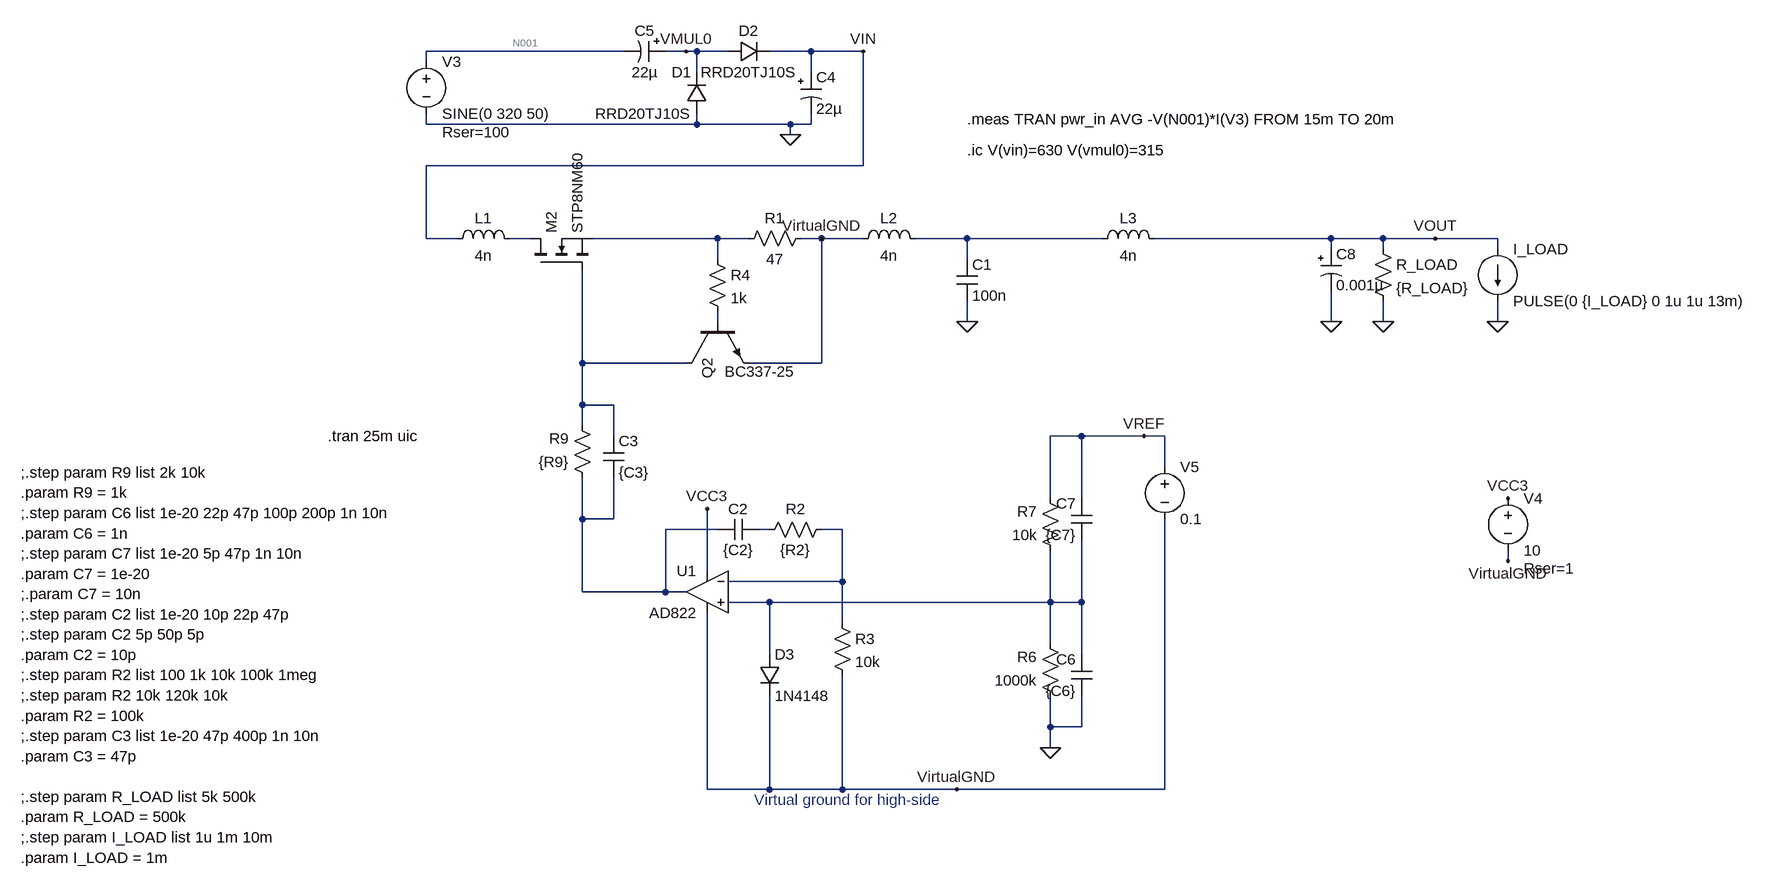
[diagram p0: schematic high_voltage_power_supply_Tim1.asc]
high_voltage_power_supply_Tim1.asc, the LTspice schematic file:
Version 4
SHEET 1 2484 1152
WIRE 464 -288 160 -288
WIRE 560 -288 528 -288
WIRE 576 -288 560 -288
WIRE 624 -288 576 -288
WIRE 752 -288 688 -288
WIRE 832 -288 752 -288
WIRE 160 -272 160 -288
WIRE 576 -256 576 -288
WIRE 752 -256 752 -288
WIRE 160 -176 160 -192
WIRE 576 -176 576 -192
WIRE 576 -176 160 -176
WIRE 720 -176 576 -176
WIRE 752 -176 752 -192
WIRE 752 -176 720 -176
WIRE 720 -160 720 -176
WIRE 832 -112 832 -288
WIRE 832 -112 160 -112
WIRE 160 0 160 -112
WIRE 208 0 160 0
WIRE 320 0 288 0
WIRE 608 0 416 0
WIRE 656 0 608 0
WIRE 768 0 736 0
WIRE 832 0 768 0
WIRE 992 0 912 0
WIRE 1200 0 992 0
WIRE 1552 0 1280 0
WIRE 1632 0 1552 0
WIRE 1712 0 1632 0
WIRE 1808 0 1712 0
WIRE 1552 16 1552 0
WIRE 1632 16 1632 0
WIRE 1808 16 1808 0
WIRE 608 32 608 0
WIRE 992 32 992 0
WIRE 608 128 608 112
WIRE 992 128 992 96
WIRE 1552 128 1552 80
WIRE 1632 128 1632 96
WIRE 1808 128 1808 96
WIRE 400 192 400 48
WIRE 560 192 400 192
WIRE 768 192 768 0
WIRE 768 192 656 192
WIRE 400 256 400 192
WIRE 448 256 400 256
WIRE 400 288 400 256
WIRE 448 304 448 256
WIRE 1168 304 1120 304
WIRE 1264 304 1168 304
WIRE 1296 304 1264 304
WIRE 1296 352 1296 304
WIRE 1120 400 1120 304
WIRE 1168 400 1168 304
WIRE 400 432 400 368
WIRE 448 432 448 368
WIRE 448 432 400 432
WIRE 608 448 528 448
WIRE 688 448 672 448
WIRE 800 448 768 448
WIRE 1824 496 1824 480
WIRE 592 512 592 416
WIRE 800 528 800 448
WIRE 800 528 624 528
WIRE 400 544 400 432
WIRE 528 544 528 448
WIRE 528 544 400 544
WIRE 560 544 528 544
WIRE 688 560 624 560
WIRE 1120 560 1120 480
WIRE 1120 560 688 560
WIRE 1168 560 1168 464
WIRE 1168 560 1120 560
WIRE 800 592 800 528
WIRE 1120 624 1120 560
WIRE 688 640 688 560
WIRE 1168 640 1168 560
WIRE 1120 752 1120 704
WIRE 1168 752 1168 704
WIRE 1168 752 1120 752
WIRE 1120 784 1120 752
WIRE 592 848 592 576
WIRE 688 848 688 704
WIRE 688 848 592 848
WIRE 800 848 800 672
WIRE 800 848 688 848
WIRE 976 848 800 848
WIRE 1296 848 1296 432
WIRE 1296 848 976 848
FLAG 992 128 0
FLAG 1632 128 0
FLAG 1712 0 VOUT
FLAG 1264 304 VREF
FLAG 720 -160 0
FLAG 832 -288 VIN
FLAG 1824 400 VCC3
FLAG 592 416 VCC3
FLAG 1808 128 0
FLAG 560 -288 VMUL0
FLAG 1120 784 0
FLAG 768 0 VirtualGND
FLAG 976 848 VirtualGND
FLAG 1824 496 VirtualGND
FLAG 1552 128 0
SYMBOL npn 560 128 M90
WINDOW 3 77 59 VRight 2
SYMATTR Value BC337-25
SYMATTR InstName Q2
SYMBOL res 640 16 R270
WINDOW 0 32 56 VTop 2
WINDOW 3 0 56 VBottom 2
SYMATTR InstName R1
SYMATTR Value 47
SYMBOL cap 976 32 R0
SYMATTR InstName C1
SYMATTR Value 100n
SYMATTR SpiceLine V=1K Irms=0 Rser=0.0493 Lser=9.64n mfg="Würth Elektronik" pn="890493425009CS WCAP-FTBE 15 x 18 x 15 x 8.5" type="Box"
SYMBOL res 1616 0 R0
SYMATTR InstName R_LOAD
SYMATTR Value {R_LOAD}
SYMBOL voltage 1824 384 R0
WINDOW 123 0 0 Left 0
WINDOW 39 24 124 Left 2
SYMATTR SpiceLine Rser=1
SYMATTR InstName V4
SYMATTR Value 10
SYMBOL res 1136 720 R180
WINDOW 0 36 76 Left 2
WINDOW 3 36 40 Left 2
SYMATTR InstName R6
SYMATTR Value 1000k
SYMBOL res 1136 496 R180
WINDOW 0 36 76 Left 2
WINDOW 3 36 40 Left 2
SYMATTR InstName R7
SYMATTR Value 10k
SYMBOL cap 672 432 R90
WINDOW 0 0 32 VBottom 2
WINDOW 3 32 32 VTop 2
SYMATTR InstName C2
SYMATTR Value {C2}
SYMATTR SpiceLine V=25 Irms=533m Rser=0.222978 Lser=0
SYMBOL voltage 1296 336 R0
WINDOW 123 0 0 Left 0
WINDOW 39 0 0 Left 0
SYMATTR InstName V5
SYMATTR Value 0.1
SYMBOL res 416 384 R180
WINDOW 0 36 76 Left 2
WINDOW 3 36 40 Left 2
SYMATTR InstName R9
SYMATTR Value {R9}
SYMBOL ind 192 16 R270
WINDOW 0 32 56 VTop 2
WINDOW 3 5 56 VBottom 2
SYMATTR InstName L1
SYMATTR Value 4n
SYMBOL ind 816 16 R270
WINDOW 0 32 56 VTop 2
WINDOW 3 5 56 VBottom 2
SYMATTR InstName L2
SYMATTR Value 4n
SYMBOL voltage 160 -288 R0
WINDOW 123 0 0 Left 0
WINDOW 39 24 124 Left 2
SYMATTR SpiceLine Rser=100
SYMATTR InstName V3
SYMATTR Value SINE(0 320 50)
SYMBOL polcap 736 -256 R0
WINDOW 3 24 56 Left 2
SYMATTR Value 22µ
SYMATTR InstName C4
SYMATTR Description Capacitor
SYMATTR Type cap
SYMATTR SpiceLine V=400 Irms=162m Rser=0.4083 Lser=4.41n mfg="Würth Elektronik" pn="860021375012 WCAP-ATG5 10x25" type="Al electrolytic"
SYMBOL polcap 528 -304 R90
WINDOW 0 0 32 VBottom 2
WINDOW 3 32 32 VTop 2
SYMATTR InstName C5
SYMATTR Value 22µ
SYMATTR Description Capacitor
SYMATTR Type cap
SYMATTR SpiceLine V=400 Irms=557m Rser=0.5269 Lser=7.55n mfg="Würth Elektronik" pn="860241378003 WCAP-AT1H 13x20" type="Al electrolytic"
SYMBOL diode 592 -192 R180
WINDOW 0 24 64 Left 2
WINDOW 3 24 0 Left 2
SYMATTR InstName D1
SYMATTR Value RRD20TJ10S
SYMBOL diode 624 -272 R270
WINDOW 0 32 32 VTop 2
WINDOW 3 0 32 VBottom 2
SYMATTR InstName D2
SYMATTR Value RRD20TJ10S
SYMBOL cap 1184 704 R180
WINDOW 3 24 8 Left 2
WINDOW 0 24 56 Left 2
SYMATTR Value {C6}
SYMATTR InstName C6
SYMATTR SpiceLine V=1K Irms=0 Rser=0 Lser=0
SYMBOL current 1808 16 R0
WINDOW 123 0 0 Left 0
WINDOW 39 0 0 Left 0
SYMATTR InstName I_LOAD
SYMATTR Value PULSE(0 {I_LOAD} 0 1u 1u 13m)
SYMBOL nmos 320 48 R270
SYMATTR InstName M2
SYMATTR Value STP8NM60
SYMBOL cap 1184 464 R180
WINDOW 3 24 8 Left 2
WINDOW 0 24 56 Left 2
SYMATTR Value {C7}
SYMATTR InstName C7
SYMBOL res 784 432 R90
WINDOW 0 0 56 VBottom 2
WINDOW 3 32 56 VTop 2
SYMATTR InstName R2
SYMATTR Value {R2}
SYMBOL res 784 576 R0
SYMATTR InstName R3
SYMATTR Value 10k
SYMBOL cap 432 304 R0
SYMATTR InstName C3
SYMATTR Value {C3}
SYMBOL OpAmps\\AD822 592 480 M0
SYMATTR InstName U1
SYMBOL res 592 16 R0
SYMATTR InstName R4
SYMATTR Value 1k
SYMBOL diode 672 640 R0
SYMATTR InstName D3
SYMATTR Value 1N4148
SYMBOL polcap 1536 16 R0
WINDOW 3 24 56 Left 2
SYMATTR Value 0.001µ
SYMATTR InstName C8
SYMATTR Description Capacitor
SYMATTR Type cap
SYMATTR SpiceLine V=450 Irms=390m Rser=1.0176 Lser=9.92n
SYMBOL ind 1184 16 R270
WINDOW 0 32 56 VTop 2
WINDOW 3 5 56 VBottom 2
SYMATTR InstName L3
SYMATTR Value 4n
TEXT 8 304 Left 2 !.tran 25m uic
TEXT -464 360 Left 2 !;.step param R9 list 2k 10k\n.param R9 = 1k\n;.step param C6 list 1e-20 22p 47p 100p 200p 1n 10n\n.param C6 = 1n\n;.step param C7 list 1e-20 5p 47p 1n 10n\n.param C7 = 1e-20\n;.param C7 = 10n\n;.step param C2 list 1e-20 10p 22p 47p\n;.step param C2 5p 50p 5p\n.param C2 = 10p\n;.step param R2 list 100 1k 10k 100k 1meg\n;.step param R2 10k 120k 10k\n.param R2 = 100k\n;.step param C3 list 1e-20 47p 400p 1n 10n\n.param C3 = 47p\n \n;.step param R_LOAD list 5k 500k\n.param R_LOAD = 500k\n;.step param I_LOAD list 1u 1m 10m\n.param I_LOAD = 1m
TEXT 992 -184 Left 2 !.meas TRAN pwr_in AVG -V(N001)*I(V3) FROM 15m TO 20m
TEXT 992 -136 Left 2 !.ic V(vin)=630 V(vmul0)=315
TEXT 664 864 Left 2 ;Virtual ground for high-side

The netlist it stands for:
* high_voltage_power_supply_Tim1.asc
Q2 N006 N005 VirtualGND 0 BC337-25
R1 N003 VirtualGND 47
C1 N004 0 100n V=1K Irms=0 Rser=0.0493 Lser=9.64n mfg="Würth Elektronik" pn="890493425009CS WCAP-FTBE 15 x 18 x 15 x 8.5" type="Box"
R_LOAD VOUT 0 {R_LOAD}
V4 VCC3 VirtualGND 10 Rser=1
R6 0 N010 1000k
R7 N010 VREF 10k
C2 N008 N007 {C2} V=25 Irms=533m Rser=0.222978 Lser=0
V5 VREF VirtualGND 0.1
R9 N007 N006 {R9}
L1 VIN N002 4n
L2 VirtualGND N004 4n
V3 N001 0 SINE(0 320 50) Rser=100
C4 VIN 0 22µ V=400 Irms=162m Rser=0.4083 Lser=4.41n mfg="Würth Elektronik" pn="860021375012 WCAP-ATG5 10x25" type="Al electrolytic"
C5 VMUL0 N001 22µ V=400 Irms=557m Rser=0.5269 Lser=7.55n mfg="Würth Elektronik" pn="860241378003 WCAP-AT1H 13x20" type="Al electrolytic"
D1 0 VMUL0 RRD20TJ10S
D2 VMUL0 VIN RRD20TJ10S
C6 0 N010 {C6} V=1K Irms=0 Rser=0 Lser=0
I_LOAD VOUT 0 PULSE(0 {I_LOAD} 0 1u 1u 13m)
M2 N002 N006 N003 N003 STP8NM60
C7 N010 VREF {C7}
R2 N009 N008 {R2}
R3 N009 VirtualGND 10k
C3 N006 N007 {C3}
XU1 N010 N009 VCC3 VirtualGND N007 AD822  ; pins In+ In- V+ V- OUT
R4 N003 N005 1k
D3 N010 VirtualGND 1N4148
C8 VOUT 0 0.001µ V=450 Irms=390m Rser=1.0176 Lser=9.92n
L3 N004 VOUT 4n
.model D D
.lib standard.dio
.model NPN NPN
.model PNP PNP
.lib standard.bjt
.model NMOS NMOS
.model PMOS PMOS
.lib standard.mos
.tran 25m uic
;.step param R9 list 2k 10k
.param R9 = 1k
;.step param C6 list 1e-20 22p 47p 100p 200p 1n 10n
.param C6 = 1n
;.step param C7 list 1e-20 5p 47p 1n 10n
.param C7 = 1e-20
;.param C7 = 10n
;.step param C2 list 1e-20 10p 22p 47p
;.step param C2 5p 50p 5p
.param C2 = 10p
;.step param R2 list 100 1k 10k 100k 1meg
;.step param R2 10k 120k 10k
.param R2 = 100k
;.step param C3 list 1e-20 47p 400p 1n 10n
.param C3 = 47p
;.step param R_LOAD list 5k 500k
.param R_LOAD = 500k
;.step param I_LOAD list 1u 1m 10m
.param I_LOAD = 1m
.meas TRAN pwr_in AVG -V(N001)*I(V3) FROM 15m TO 20m
.ic V(vin)=630 V(vmul0)=315
* Virtual ground for high-side
.backanno
.end